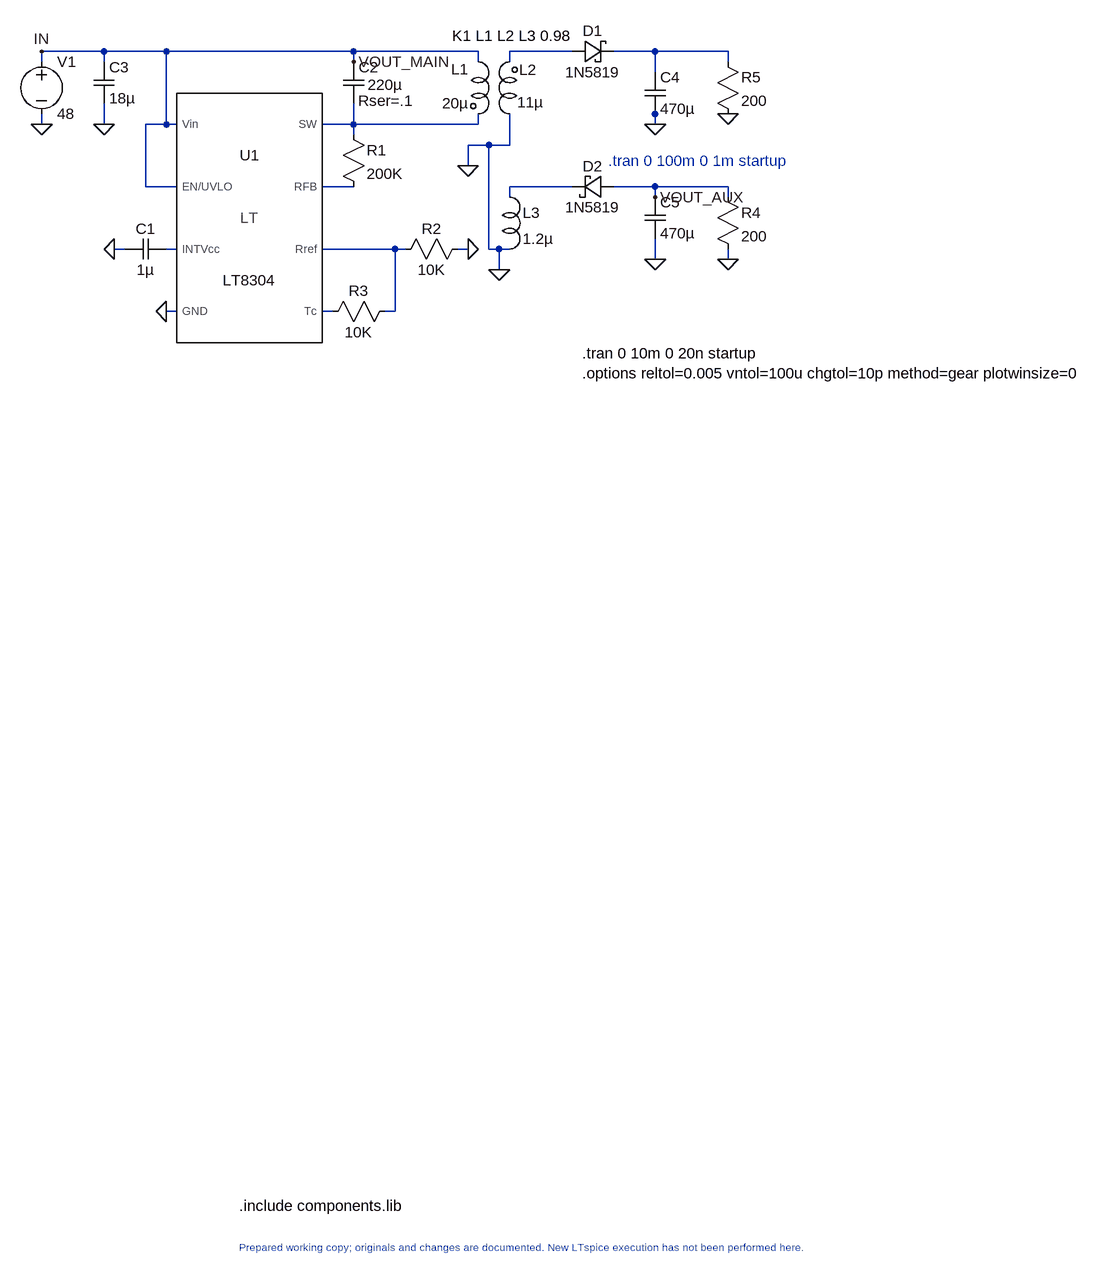
[diagram p0: schematic Model.asc]
Model.asc, the LTspice schematic file:
Version 4.1
SHEET 1 1428 680
WIRE -176 -112 -272 -112
WIRE -80 -112 -176 -112
WIRE 208 -112 -80 -112
WIRE 400 -112 208 -112
WIRE 544 -112 448 -112
WIRE 672 -112 608 -112
WIRE 784 -112 672 -112
WIRE -272 -96 -272 -112
WIRE -176 -96 -176 -112
WIRE 208 -96 208 -112
WIRE 400 -96 400 -112
WIRE 448 -96 448 -112
WIRE 784 -96 784 -112
WIRE 672 -80 672 -112
WIRE 672 -16 672 -32
WIRE -272 0 -272 -16
WIRE -176 0 -176 -32
WIRE -80 0 -80 -112
WIRE -80 0 -112 0
WIRE -64 0 -80 0
WIRE 208 0 208 -32
WIRE 208 0 160 0
WIRE 400 0 400 -16
WIRE 400 0 208 0
WIRE 672 0 672 -16
WIRE 208 16 208 0
WIRE 416 32 384 32
WIRE 448 32 448 -16
WIRE 448 32 416 32
WIRE 384 64 384 32
WIRE -112 96 -112 0
WIRE -64 96 -112 96
WIRE 208 96 160 96
WIRE 544 96 448 96
WIRE 672 96 608 96
WIRE 784 96 672 96
WIRE 448 112 448 96
WIRE 672 112 672 96
WIRE 784 112 784 96
WIRE -144 192 -160 192
WIRE -64 192 -80 192
WIRE 272 192 160 192
WIRE 288 192 272 192
WIRE 384 192 368 192
WIRE 416 192 416 32
WIRE 432 192 416 192
WIRE 448 192 432 192
WIRE 672 208 672 176
WIRE 784 208 784 192
WIRE 432 224 432 192
WIRE -64 288 -80 288
WIRE 176 288 160 288
WIRE 272 288 272 192
WIRE 272 288 256 288
FLAG -80 288 0
FLAG -272 0 0
FLAG -160 192 0
FLAG 384 192 0
FLAG -272 -112 IN
FLAG 672 0 0
FLAG -176 0 0
FLAG 672 208 0
FLAG 784 -16 0
FLAG 384 64 0
FLAG 432 224 0
FLAG 784 208 0
SYMBOL voltage -272 -112 R0
SYMATTR InstName V1
SYMATTR Value 48
SYMBOL cap -80 176 R90
WINDOW 0 0 32 VBottom 2
WINDOW 3 32 32 VTop 2
SYMATTR InstName C1
SYMATTR Value 1µ
SYMBOL ind2 384 -112 R0
WINDOW 0 1 27 Right 2
WINDOW 3 1 80 Right 2
SYMATTR InstName L1
SYMATTR Value 20µ
SYMATTR Type ind
SYMATTR SpiceLine Rser=1m Rpar=100k Cpar=5p
SYMBOL ind2 464 0 R180
WINDOW 0 1 84 Right 2
WINDOW 3 4 34 Right 2
SYMATTR InstName L2
SYMATTR Value 11µ
SYMATTR Type ind
SYMATTR SpiceLine Rser=1m
SYMBOL schottky 544 -96 R270
WINDOW 0 32 32 VTop 2
WINDOW 3 0 32 VBottom 2
SYMATTR InstName D1
SYMATTR Value 1N5819
SYMATTR Description Diode
SYMATTR Type diode
SYMBOL cap 192 -96 R0
WINDOW 39 23 60 Left 2
WINDOW 3 38 35 Left 2
SYMATTR SpiceLine Rser=.1
SYMATTR Value 220µ
SYMATTR InstName C2
SYMBOL res 192 0 R0
SYMATTR InstName R1
SYMATTR Value 200K
SYMBOL res 272 208 R270
WINDOW 0 32 56 VTop 2
WINDOW 3 0 56 VBottom 2
SYMATTR InstName R2
SYMATTR Value 10K
SYMBOL LT8304 48 144 R0
SYMATTR InstName U1
SYMBOL cap -192 -96 R0
SYMATTR InstName C3
SYMATTR Value 18µ
SYMBOL schottky 608 80 R90
WINDOW 0 0 32 VBottom 2
WINDOW 3 32 32 VTop 2
SYMATTR InstName D2
SYMATTR Value 1N5819
SYMATTR Description Diode
SYMATTR Type diode
SYMBOL ind 432 96 R0
SYMATTR InstName L3
SYMATTR Value 1.2µ
SYMATTR SpiceLine Rser=1m
SYMATTR Type ind
SYMBOL cap 656 -80 R0
SYMATTR InstName C4
SYMATTR Value 470µ
SYMATTR SpiceLine Rser=.1
SYMBOL cap 656 112 R0
SYMATTR InstName C5
SYMATTR Value 470µ
SYMBOL res 768 -112 R0
SYMATTR InstName R5
SYMATTR Value 200
SYMBOL res 272 272 R90
WINDOW 0 0 56 VBottom 2
WINDOW 3 32 56 VTop 2
SYMATTR InstName R3
SYMATTR Value 10K
SYMBOL res 768 96 R0
SYMATTR InstName R4
SYMATTR Value 200
TEXT 360 -136 Left 2 !K1 L1 L2 L3 0.98
TEXT 600 56 Left 2 ;.tran 0 100m 0 1m startup
TEXT 560 352 Left 2 !.tran 0 10m 0 20n startup\n.options reltol=0.005 vntol=100u chgtol=10p method=gear plotwinsize=0
FLAG 208 -96 VOUT_MAIN
FLAG 672 112 VOUT_AUX
TEXT 32 1664 Left 2 !.include components.lib
TEXT 32 1728 Left 1 ;Prepared working copy; originals and changes are documented. New LTspice execution has not been performed here.

The netlist it stands for:
* Model.asc
V1 VOUT_MAIN 0 48
C1 N006 0 1µ
L1 VOUT_MAIN N003 20µ Rser=1m Rpar=100k Cpar=5p
L2 0 N001 11µ Rser=1m
D1 N001 N002 1N5819
C2 VOUT_MAIN N003 220µ Rser=.1
R1 N003 N004 200K
R2 N007 0 10K
X§U1 VOUT_MAIN N006 VOUT_MAIN 0 N003 N004 N007 N008 LT8304  ; pins EN/UVLO INTVcc Vin GND SW RFB Rref Tc
C3 VOUT_MAIN 0 18µ
D2 VOUT_AUX N005 1N5819
L3 N005 0 1.2µ Rser=1m
C4 N002 0 470µ Rser=.1
C5 VOUT_AUX 0 470µ
R5 N002 0 200
R3 N007 N008 10K
R4 VOUT_AUX 0 200
.model D D
.lib standard.dio
K1 L1 L2 L3 0.98
* .tran 0 100m 0 1m startup
.tran 0 10m 0 20n startup
.options reltol=0.005 vntol=100u chgtol=10p method=gear plotwinsize=0
.include components.lib
* Prepared working copy; originals and changes are documented. New LTspice execution has not been performed here.
.lib LT8304.sub
.backanno
.end